# EasyEDA Pro project ProPrj_PPTC SMD research_2026-07-07.epro

# Schematic Schematic1
Board Name: Board1; Create Date: 2026-07-04; Page Name: P1; Project Name: PPTC SMD research; Schematic Name: Schematic1; Update Date: 2026-07-04; Company: EasyEDA.com; Page Size: A4; Version: V1.0
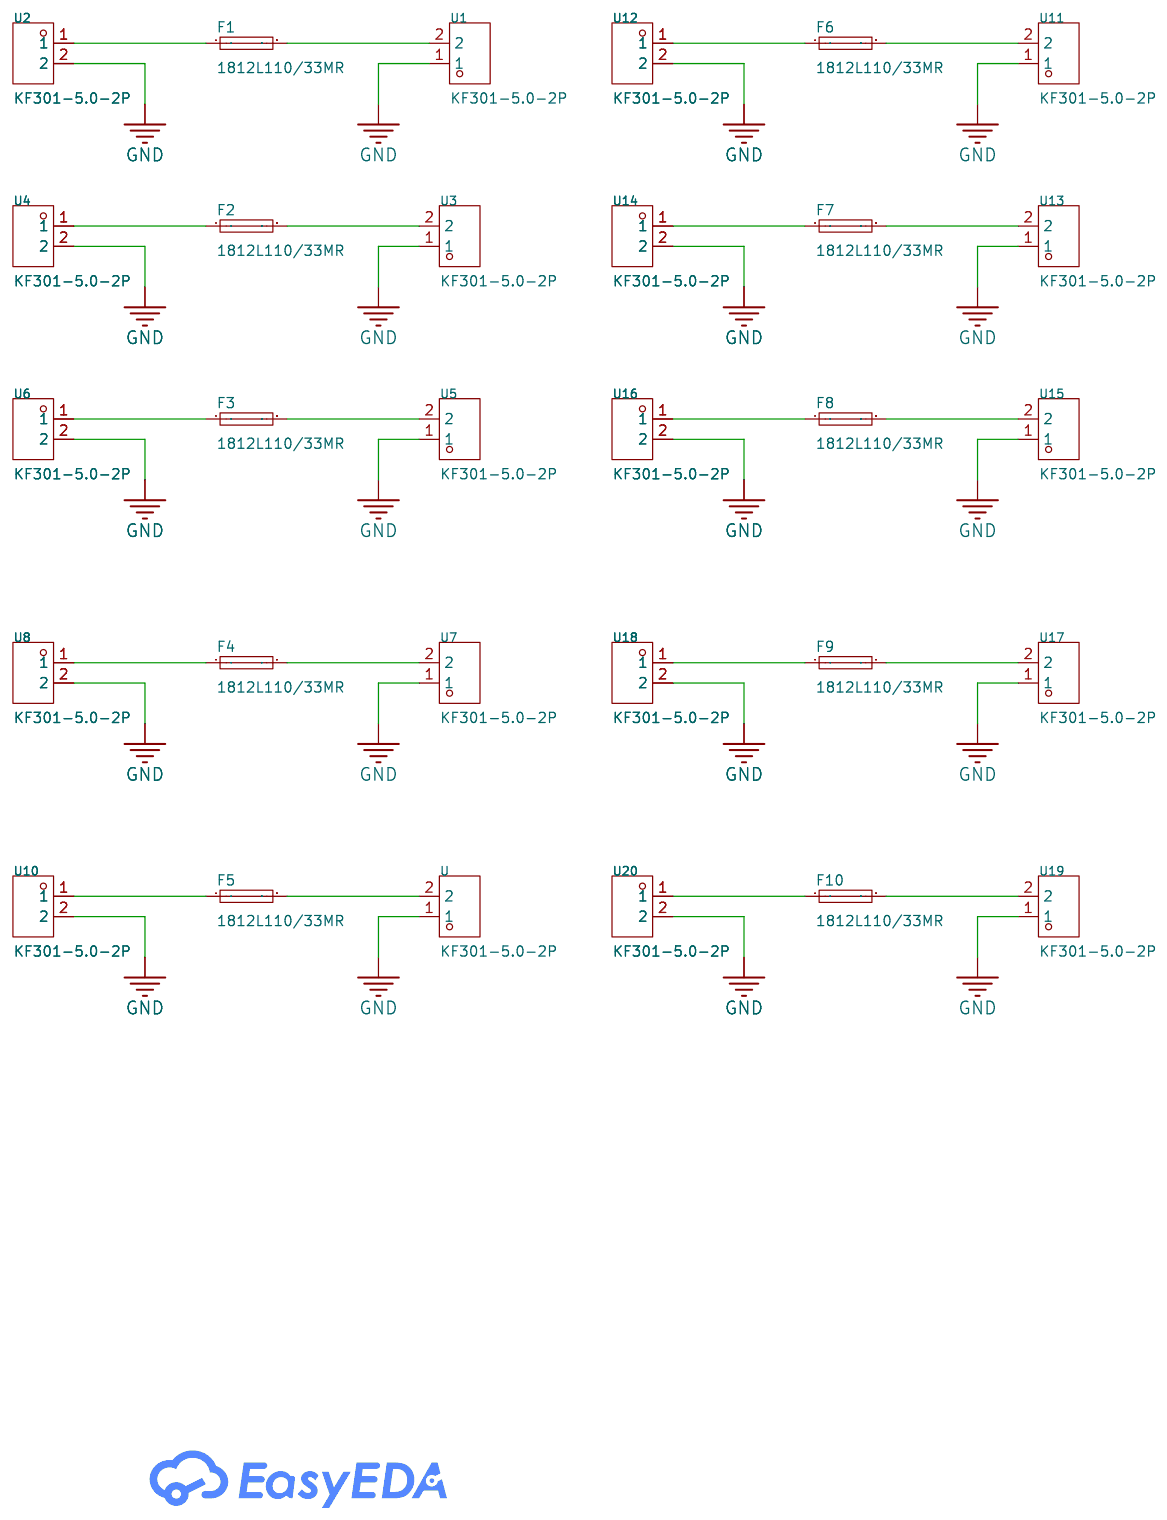
[diagram p0: schematic sheet]

## Parts
F1  1812L110/33MR  [F1812]
F2  1812L110/33MR  [F1812]
F3  1812L110/33MR  [F1812]
F4  1812L110/33MR  [F1812]
F5  1812L110/33MR  [F1812]
F6  1812L110/33MR  [F1812]
F7  1812L110/33MR  [F1812]
F8  1812L110/33MR  [F1812]
F9  1812L110/33MR  [F1812]
F10  1812L110/33MR  [F1812]
U  KF301-5.0-2P  [CONN-TH_P5.00_KF301-5.0-2P]
U1  KF301-5.0-2P  [CONN-TH_P5.00_KF301-5.0-2P]
U2  KF301-5.0-2P  [CONN-TH_P5.00_KF301-5.0-2P]
U3  KF301-5.0-2P  [CONN-TH_P5.00_KF301-5.0-2P]
U4  KF301-5.0-2P  [CONN-TH_P5.00_KF301-5.0-2P]
U5  KF301-5.0-2P  [CONN-TH_P5.00_KF301-5.0-2P]
U6  KF301-5.0-2P  [CONN-TH_P5.00_KF301-5.0-2P]
U7  KF301-5.0-2P  [CONN-TH_P5.00_KF301-5.0-2P]
U8  KF301-5.0-2P  [CONN-TH_P5.00_KF301-5.0-2P]
U10  KF301-5.0-2P  [CONN-TH_P5.00_KF301-5.0-2P]
U11  KF301-5.0-2P  [CONN-TH_P5.00_KF301-5.0-2P]
U12  KF301-5.0-2P  [CONN-TH_P5.00_KF301-5.0-2P]
U13  KF301-5.0-2P  [CONN-TH_P5.00_KF301-5.0-2P]
U14  KF301-5.0-2P  [CONN-TH_P5.00_KF301-5.0-2P]
U15  KF301-5.0-2P  [CONN-TH_P5.00_KF301-5.0-2P]
U16  KF301-5.0-2P  [CONN-TH_P5.00_KF301-5.0-2P]
U17  KF301-5.0-2P  [CONN-TH_P5.00_KF301-5.0-2P]
U18  KF301-5.0-2P  [CONN-TH_P5.00_KF301-5.0-2P]
U19  KF301-5.0-2P  [CONN-TH_P5.00_KF301-5.0-2P]
U20  KF301-5.0-2P  [CONN-TH_P5.00_KF301-5.0-2P]

## Library data of the parts
F1-F10 = 1812L110/33MR: Voltage - Max:33V Current - Max:20A Hold Current:1.1A Trip Current:1.95A Power Dissipation:800mW Resistance - Initial (Ri) (Min):60mΩ Resistance - Post Trip (R1) (Max):200mΩ Time to Trip(Max):500ms Operating Temperature:-40℃~+85℃ Operating Temperature:-40; LCSC Part Name: 33V 1.1A 1812自恢复; Supplier Part: C142747; Manufacturer: Littelfuse(美国力特); Supplier Footprint: 1812; JLCPCB Part Class: Extended Part; Datasheet: https://item.szlcsc.com/datasheet/1812L110%252F33MR/154078.html; Supplier: LCSC; Voltage - Max: 33V; Current - Max: 20A; Hold Current: 1.1A; Trip Current: 1.95A; Power Dissipation: 800mW; Resistance - Initial (Ri) (Min): 60mΩ; Resistance - Post Trip (R1) (Max): 200mΩ; Time to Trip(Max): 500ms; Operating Temperature: -40℃~+85℃; Length: 4.73mm; Width: 3.41mm; Height: 2mm
U U1-U8 U10-U20 = KF301-5.0-2P: Number of Positions or Pins:1x2P Pitch:5mm Color:Blue Mounting Type:Through Hole Number of Pins:2P Number of Rows:1 Number of PINs Per Row:2 Current Rating:17A Voltage Rating (Max):250V Wire Gauge - AWG:14~22 Wire Gauge - mm2:1.5 Wire Gauge - mm2:1.5 Oper; LCSC Part Name: 1x2P 5mm 直插 排数:1 每排P数:2; Supplier Part: C474881; Manufacturer: KEFA(科发); Supplier Footprint: 插件,P=5mm; JLCPCB Part Class: Extended Part; Datasheet: https://item.szlcsc.com/datasheet/KF301-5.0-2P/481499.html; Supplier: LCSC; Number of Positions or Pins: 1x2P; Pitch: 5mm; Color: Blue; Mounting Type: Through Hole; Number of Pins: 2P; Number of Rows: 1; Number of PINs Per Row: 2; Current Rating: 17A; Voltage Rating (Max): 250V; Wire Gauge - AWG: 14~22; Wire Gauge - mm2: 1.5; Operating Temperature: -30℃~+120℃

## Nets
GND: U.1 U1.1 U2.2 U3.1 U4.2 U5.1 U6.2 U7.1 U8.2 U10.2 U11.1 U12.2 U13.1 U14.2 U15.1 U16.2 U17.1 U18.2 U19.1 U20.2
$1N275: F1.1 U2.1
$1N279: F1.2 U1.2
$1N477: F2.1 U4.1
$1N479: F2.2 U3.2
$1N638: F3.1 U6.1
$1N640: F3.2 U5.2
$1N799: F4.1 U8.1
$1N801: F4.2 U7.2
$1N960: F5.1 U10.1
$1N1717: F6.1 U12.1
$1N1719: F6.2 U11.2
$1N1727: F7.1 U14.1
$1N1729: F7.2 U13.2
$1N1737: F8.1 U16.1
$1N1739: F8.2 U15.2
$1N1747: F9.1 U18.1
$1N1749: F9.2 U17.2
$1N1757: F10.1 U20.1
$1N1759: F10.2 U19.2
Net-(F5-2): F5.2 U.2

# Board PCB1
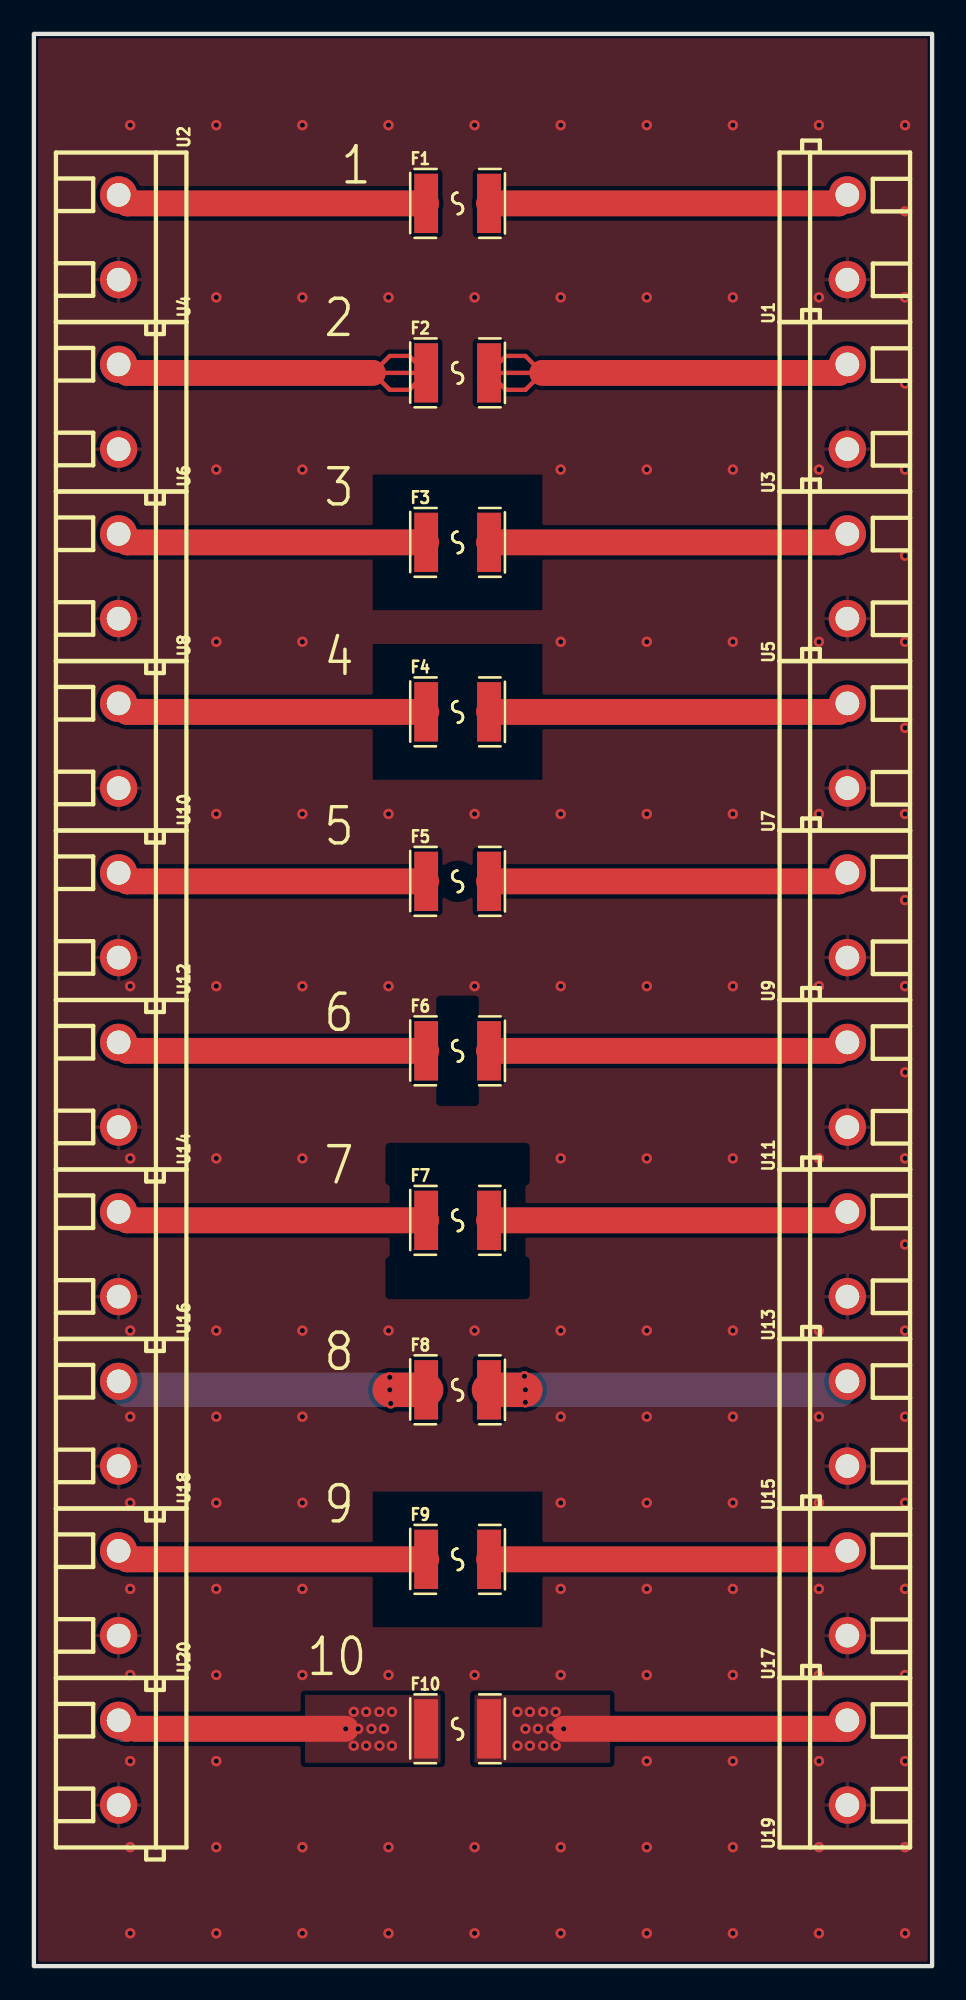
[diagram p1: board, top side]
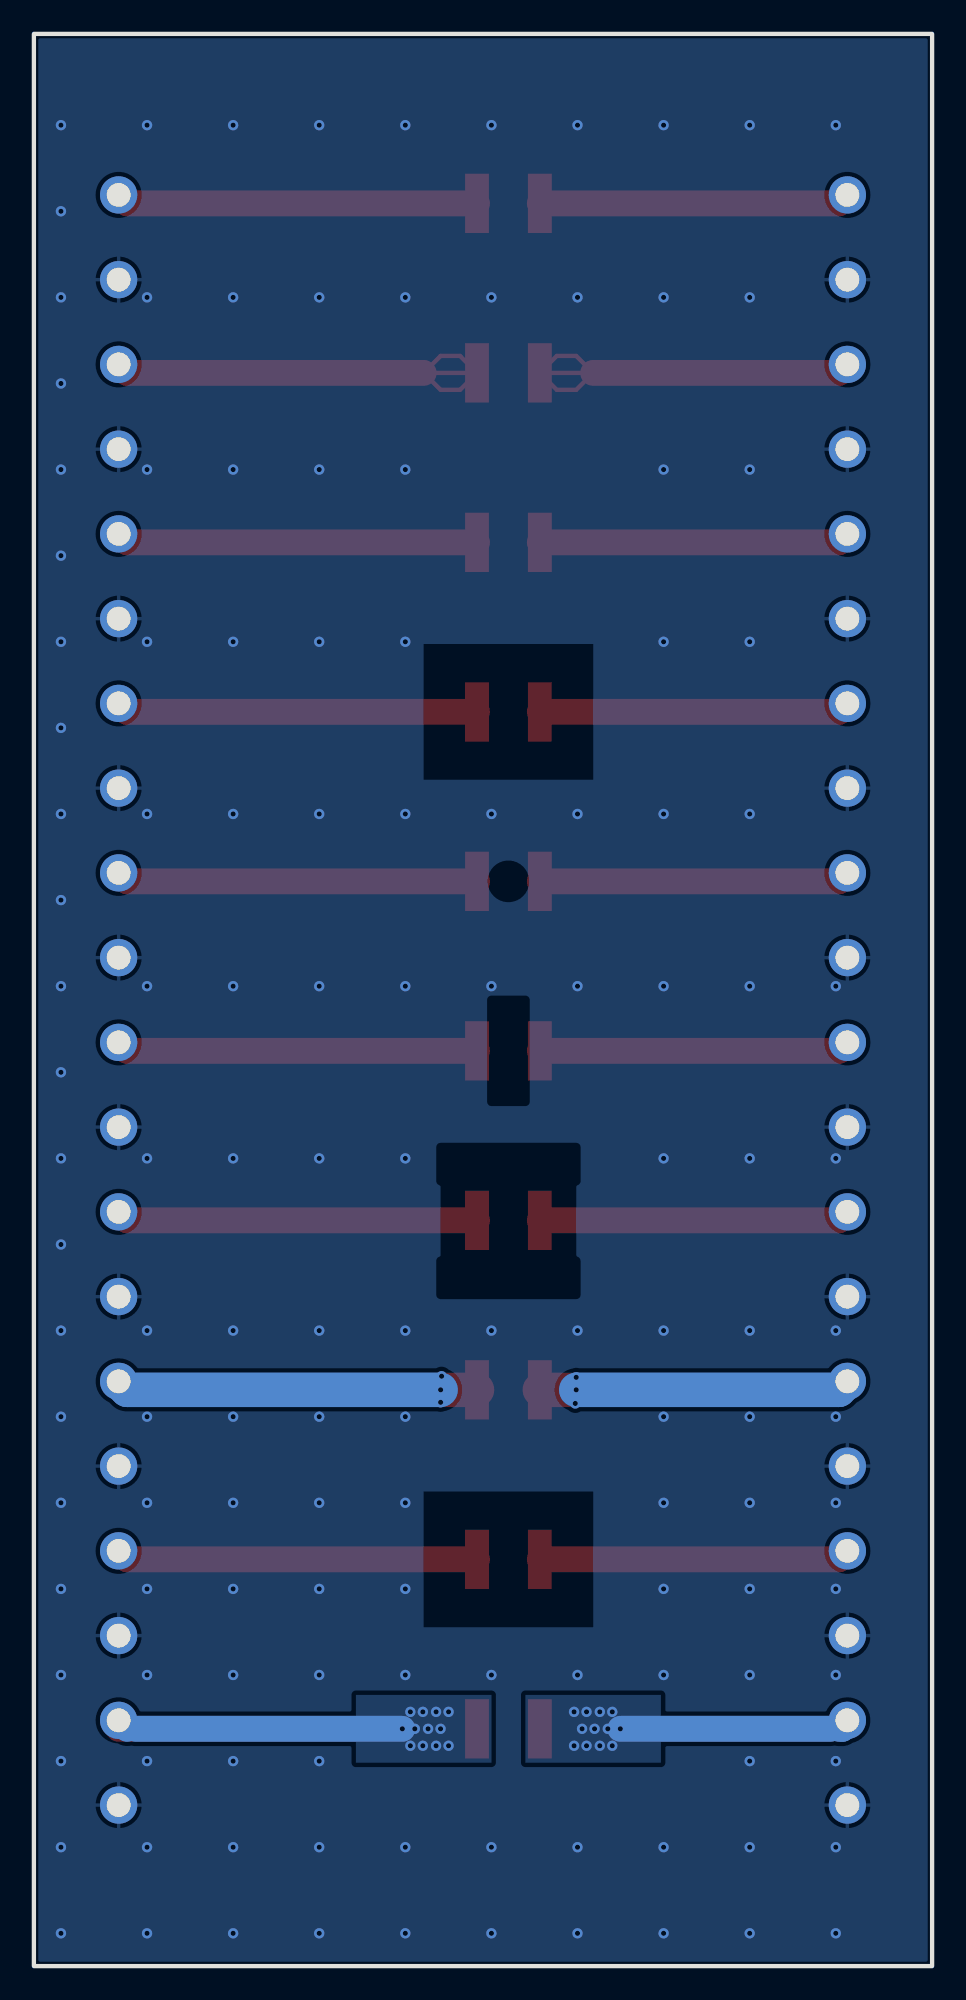
[diagram p2: board, bottom side, seen from below]

Outline 53 x 114 mm; copper layers: Top Layer, Bottom Layer. Coordinates in mm from the lower left corner of the outline.
Outline path: rectangle 0,114 53,0
Stack: Top Layer 0.035mm / Dielectric1 1.51mm FR4 er 4.5 / Bottom Layer 0.035mm

## Design rules (mm)
template: JLCPCB Capability(Two Layers Board)
spacing copperThickness1oz (default): track to track 0.102, other pairs 0.152 to 0.3
spacing copperThickness2oz: track to track 0.203, other pairs 0.152 to 0.3
track width copperThickness1oz (default): min 0.127, default 0.254, max 2.54
track width copperThickness2oz: min 0.203, default 0.254, max 2.54
differential pair differentialPair (default): width min 0.127, default 0.254, max 2.54; gap min 0.152, default 0.152
via viaSize (default): diameter min 0.5, default 0.61, max 10; hole min 0.3, default 0.305, max 6.3

## Placement (name value [footprint] x y rotation side)
F1  1812L110/33MR  [F1812]  25 104 0 top
F2  1812L110/33MR  [F1812]  25 94 0 top
F3  1812L110/33MR  [F1812]  25 84 0 top
F4  1812L110/33MR  [F1812]  25 74 0 top
F5  1812L110/33MR  [F1812]  25 64 0 top
F6  1812L110/33MR  [F1812]  25 54 0 top
F7  1812L110/33MR  [F1812]  25 44 0 top
F8  1812L110/33MR  [F1812]  25 34 0 top
F9  1812L110/33MR  [F1812]  25 24 0 top
F10  1812L110/33MR  [F1812]  25 14 0 top
U1  KF301-5.0-2P  [CONN-TH_P5.00_KF301-5.0-2P]  48 102 90 top
U2  KF301-5.0-2P  [CONN-TH_P5.00_KF301-5.0-2P]  5 102 270 top
U3  KF301-5.0-2P  [CONN-TH_P5.00_KF301-5.0-2P]  48 92 90 top
U4  KF301-5.0-2P  [CONN-TH_P5.00_KF301-5.0-2P]  5 92 270 top
U5  KF301-5.0-2P  [CONN-TH_P5.00_KF301-5.0-2P]  48 82 90 top
U6  KF301-5.0-2P  [CONN-TH_P5.00_KF301-5.0-2P]  5 82 270 top
U7  KF301-5.0-2P  [CONN-TH_P5.00_KF301-5.0-2P]  48 72 90 top
U8  KF301-5.0-2P  [CONN-TH_P5.00_KF301-5.0-2P]  5 72 270 top
U9  KF301-5.0-2P  [CONN-TH_P5.00_KF301-5.0-2P]  48 62 90 top
U10  KF301-5.0-2P  [CONN-TH_P5.00_KF301-5.0-2P]  5 62 270 top
U11  KF301-5.0-2P  [CONN-TH_P5.00_KF301-5.0-2P]  48 52 90 top
U12  KF301-5.0-2P  [CONN-TH_P5.00_KF301-5.0-2P]  5 52 270 top
U13  KF301-5.0-2P  [CONN-TH_P5.00_KF301-5.0-2P]  48 42 90 top
U14  KF301-5.0-2P  [CONN-TH_P5.00_KF301-5.0-2P]  5 42 270 top
U15  KF301-5.0-2P  [CONN-TH_P5.00_KF301-5.0-2P]  48 32 90 top
U16  KF301-5.0-2P  [CONN-TH_P5.00_KF301-5.0-2P]  5 32 270 top
U17  KF301-5.0-2P  [CONN-TH_P5.00_KF301-5.0-2P]  48 22 90 top
U18  KF301-5.0-2P  [CONN-TH_P5.00_KF301-5.0-2P]  5 22 270 top
U19  KF301-5.0-2P  [CONN-TH_P5.00_KF301-5.0-2P]  48 12 90 top
U20  KF301-5.0-2P  [CONN-TH_P5.00_KF301-5.0-2P]  5 12 270 top

## Footprints (pads in the part's own frame, mm; a bottom-side part is the same pattern mirrored in y, then rotated)
CONN-TH_P5.00_KF301-5.0-2P
  round 2.2 hole 1.4: 1(-2.5,0) 2(2.5,0)
F1812
  rect 1.407x3.499 smd: 1(-1.853,0) 2(1.853,0)

## Nets
As in the schematic, except:
GND: U1.1 U2.2 U3.1 U4.2 U5.1 U6.2 U7.1 U8.2 U9.1 U10.2 U11.1 U12.2 U13.1 U14.2 U15.1 U16.2 U17.1 U18.2 U19.1 U20.2
$1N962: F5.2 U9.2

## Via types
v1: diameter 0.61, hole 0.305, Top Layer to Bottom Layer, 167 vias

## Routing (per net, layer and track width the routed paths; a pad name or vN(x,y) marks a point on that pad's centre or on a via; arc(x,y) is an arc through that point)
GND:
  vias: v1(5.68,108.62) v1(5.68,57.81) v1(5.68,47.66) v1(5.68,37.5) v1(5.68,32.42) v1(5.68,27.34) v1(5.68,22.25) v1(5.68,17.18) v1(5.68,12.09) v1(5.68,7.01) v1(5.68,1.94) v1(10.76,108.62) v1(10.76,98.45) v1(10.76,88.3) v1(10.76,78.14) v1(10.76,67.97) v1(10.76,57.81) v1(10.76,47.66) v1(10.76,37.5) v1(10.76,32.42) v1(10.76,27.34) v1(10.76,22.25) v1(10.76,17.18) v1(10.76,12.09) v1(10.76,7.01) v1(10.76,1.94) v1(15.84,108.62) v1(15.84,98.45) v1(15.84,88.3) v1(15.84,78.14) v1(15.84,67.97) v1(15.84,57.81) v1(15.84,47.66) v1(15.84,37.5) v1(15.84,32.42) v1(15.84,27.34) v1(15.84,22.25) v1(15.84,17.18) v1(15.84,7.01) v1(15.84,1.94) v1(20.92,108.62) v1(20.92,98.45) v1(20.92,67.97) v1(20.92,57.81) v1(20.92,37.5) v1(20.92,17.18) v1(20.92,7.01) v1(20.92,1.94) v1(26,108.62) v1(26,98.45) v1(26,67.97) v1(26,57.81) v1(26,37.5) v1(26,17.18) v1(26,7.01) v1(26,1.94) v1(31.08,108.62) v1(31.08,98.45) v1(31.08,88.3) v1(31.08,78.14) v1(31.08,67.97) v1(31.08,57.81) v1(31.08,47.66) v1(31.08,37.5) v1(31.08,32.42) v1(31.08,27.34) v1(31.08,22.25) v1(31.08,17.18) v1(31.08,7.01) v1(31.08,1.94) v1(36.16,108.62) v1(36.16,98.45) v1(36.16,88.3) v1(36.16,78.14) v1(36.16,67.97) v1(36.16,57.81) v1(36.16,47.66) v1(36.16,37.5) v1(36.16,32.42) v1(36.16,27.34) v1(36.16,22.25) v1(36.16,17.18) v1(36.16,12.09) v1(36.16,7.01) v1(36.16,1.94) v1(41.24,108.62) v1(41.24,98.45) v1(41.24,88.3) v1(41.24,78.14) v1(41.24,67.97) v1(41.24,57.81) v1(41.24,47.66) v1(41.24,37.5) v1(41.24,32.42) v1(41.24,27.34) v1(41.24,22.25) v1(41.24,17.18) v1(41.24,12.09) v1(41.24,7.01) v1(41.24,1.94) v1(46.32,108.62) v1(46.32,98.45) v1(46.32,88.3) v1(46.32,78.14) v1(46.32,67.97) v1(46.32,57.81) v1(46.32,47.66) v1(46.32,37.5) v1(46.32,32.42) v1(46.32,27.34) v1(46.32,22.25) v1(46.32,17.18) v1(46.32,12.09) v1(46.32,7.01) v1(46.32,1.94) v1(51.4,108.62) v1(51.4,103.53) v1(51.4,98.45) v1(51.4,93.38) v1(51.4,88.3) v1(51.4,83.22) v1(51.4,78.14) v1(51.4,73.06) v1(51.4,67.97) v1(51.4,62.89) v1(51.4,57.81) v1(51.4,52.73) v1(51.4,47.66) v1(51.4,42.58) v1(51.4,37.5) v1(51.4,32.42) v1(51.4,27.34) v1(51.4,22.25) v1(51.4,17.18) v1(51.4,12.09) v1(51.4,7.01) v1(51.4,1.94)
$1N275: length 18.4
  Top Layer w1.524: F1.1 5.5,104 U2.1
$1N279: length 21.4
  Top Layer w1.524: U1.2 47.5,104 F1.2
$1N477: length 26.3
  Top Layer w0.254: 20,94 21,93 22.15,93 F2.1 ; 20,94 F2.1 ; 20,94 21,95 22.15,95 F2.1
  Top Layer w1.524: 20,94 5.5,94 U4.1
$1N479: length 29.3
  Top Layer w0.254: F2.2 27.85,95 29,95 30,94 ; F2.2 30,94 ; F2.2 27.85,93 29,93 30,94
  Top Layer w1.524: U3.2 47.5,94 30,94
$1N638: length 18.4
  Top Layer w1.524: F3.1 5.5,84 U6.1
$1N640: length 21.4
  Top Layer w1.524: F3.2 47.5,84 U5.2
$1N799: length 18.4
  Top Layer w1.524: U8.1 5.5,74 F4.1
$1N801: length 21.4
  Top Layer w1.524: U7.2 47.5,74 F4.2
$1N960: length 18.4
  Top Layer w1.524: U10.1 5.5,64 F5.1
$1N962: length 21.4
  Top Layer w1.524: F5.2 47.5,64 U9.2
$1N1717: length 18.4
  Top Layer w1.524: U12.1 5.5,54 F6.1
$1N1719: length 21.4
  Top Layer w1.524: U11.2 47.5,54 F6.2
$1N1727: length 18.4
  Top Layer w1.524: F7.1 5.5,44 U14.1
$1N1729: length 21.4
  Top Layer w1.524: F7.2 47.5,44 U13.2
$1N1737: length 18.4
  Top Layer w2.032: F8.1 v1(21,34)
  Bottom Layer w2.032: U16.1 5.5,34 v1(21,34)
  vias: v1(21,34.74) v1(21.06,33.2)
$1N1739: length 21.4
  Top Layer w2.032: F8.2 v1(29,34)
  Bottom Layer w2.032: U15.2 47.5,34 v1(29,34)
  vias: v1(28.94,34.8) v1(29,33.26)
$1N1747: length 18.4
  Top Layer w1.524: U18.1 5.5,24 F9.1
$1N1749: length 21.4
  Top Layer w1.524: U17.2 47.5,24 F9.2
$1N1757: length 26.4
  Top Layer w1.524: 6,14 v1(18.4,14) ; 5.5,14 U20.1
  Bottom Layer w1.524: 4.79,14.5 5.29,14 5.5,14 ; 6,14 v1(18.4,14)
  vias: v1(18.87,15) v1(18.87,13) v1(19.13,14) v1(19.61,15) v1(19.61,13) v1(19.92,14) v1(20.39,15) v1(20.39,13) v1(20.65,14) v1(21.13,15) v1(21.13,13)
$1N1759: length 34.6
  Top Layer w1.524: 48,14 47.5,14 ; 47.5,14 U19.2 47.5,14 ; 47.5,14 v1(31.26,14)
  Bottom Layer w1.524: v1(31.26,14) 47,14 ; 47.5,14 U19.2
  vias: v1(28.53,15) v1(28.53,13) v1(29,14) v1(29.27,15) v1(29.27,13) v1(29.74,14) v1(30.05,15) v1(30.05,13) v1(30.52,14) v1(30.79,15) v1(30.79,13)

## Copper pours and planes (outline as drawn; the poured copper is in the pictures)
GND on Top Layer: 0,114 53,114 53,0 0,0
GND on Bottom Layer: 0,114 53,114 53,0 0,0
$1N1757 on Top Layer: 16,16 24,16 24,12 16,12
$1N1757 on Bottom Layer: 16,16 24,16 24,12 16,12
$1N1759 on Top Layer: 26,16 34,16 34,12 26,12
$1N1759 on Bottom Layer: 26,16 34,16 34,12 26,12

## Text on the board
Top Silkscreen Layer: 10 | 2 | 3 | 4 | 5 | 6 | 7 | 8 | 9 | 1
